# EasyEDA Pro project CAN Bus IO Module.epro, schematic Automotive Dashboard_1

## Sheets
1 Power and Connectors: Board Name: Automotive Dashboard; Create Date: 2026-03-18; Page Name: Power and Connectors; Project Name: PCB_PCB_Automotive-Dashboard_2025-10-05; Schematic Name: Automotive Dashboard; Update Date: 2026-04-06; Add into BOM: yes; Company: Indeterminate Design; Convert to PCB: yes; Date: 2024-12-05; Draw By: bselen; REV: 1.0; Sheet: 1/1; spicePre: .
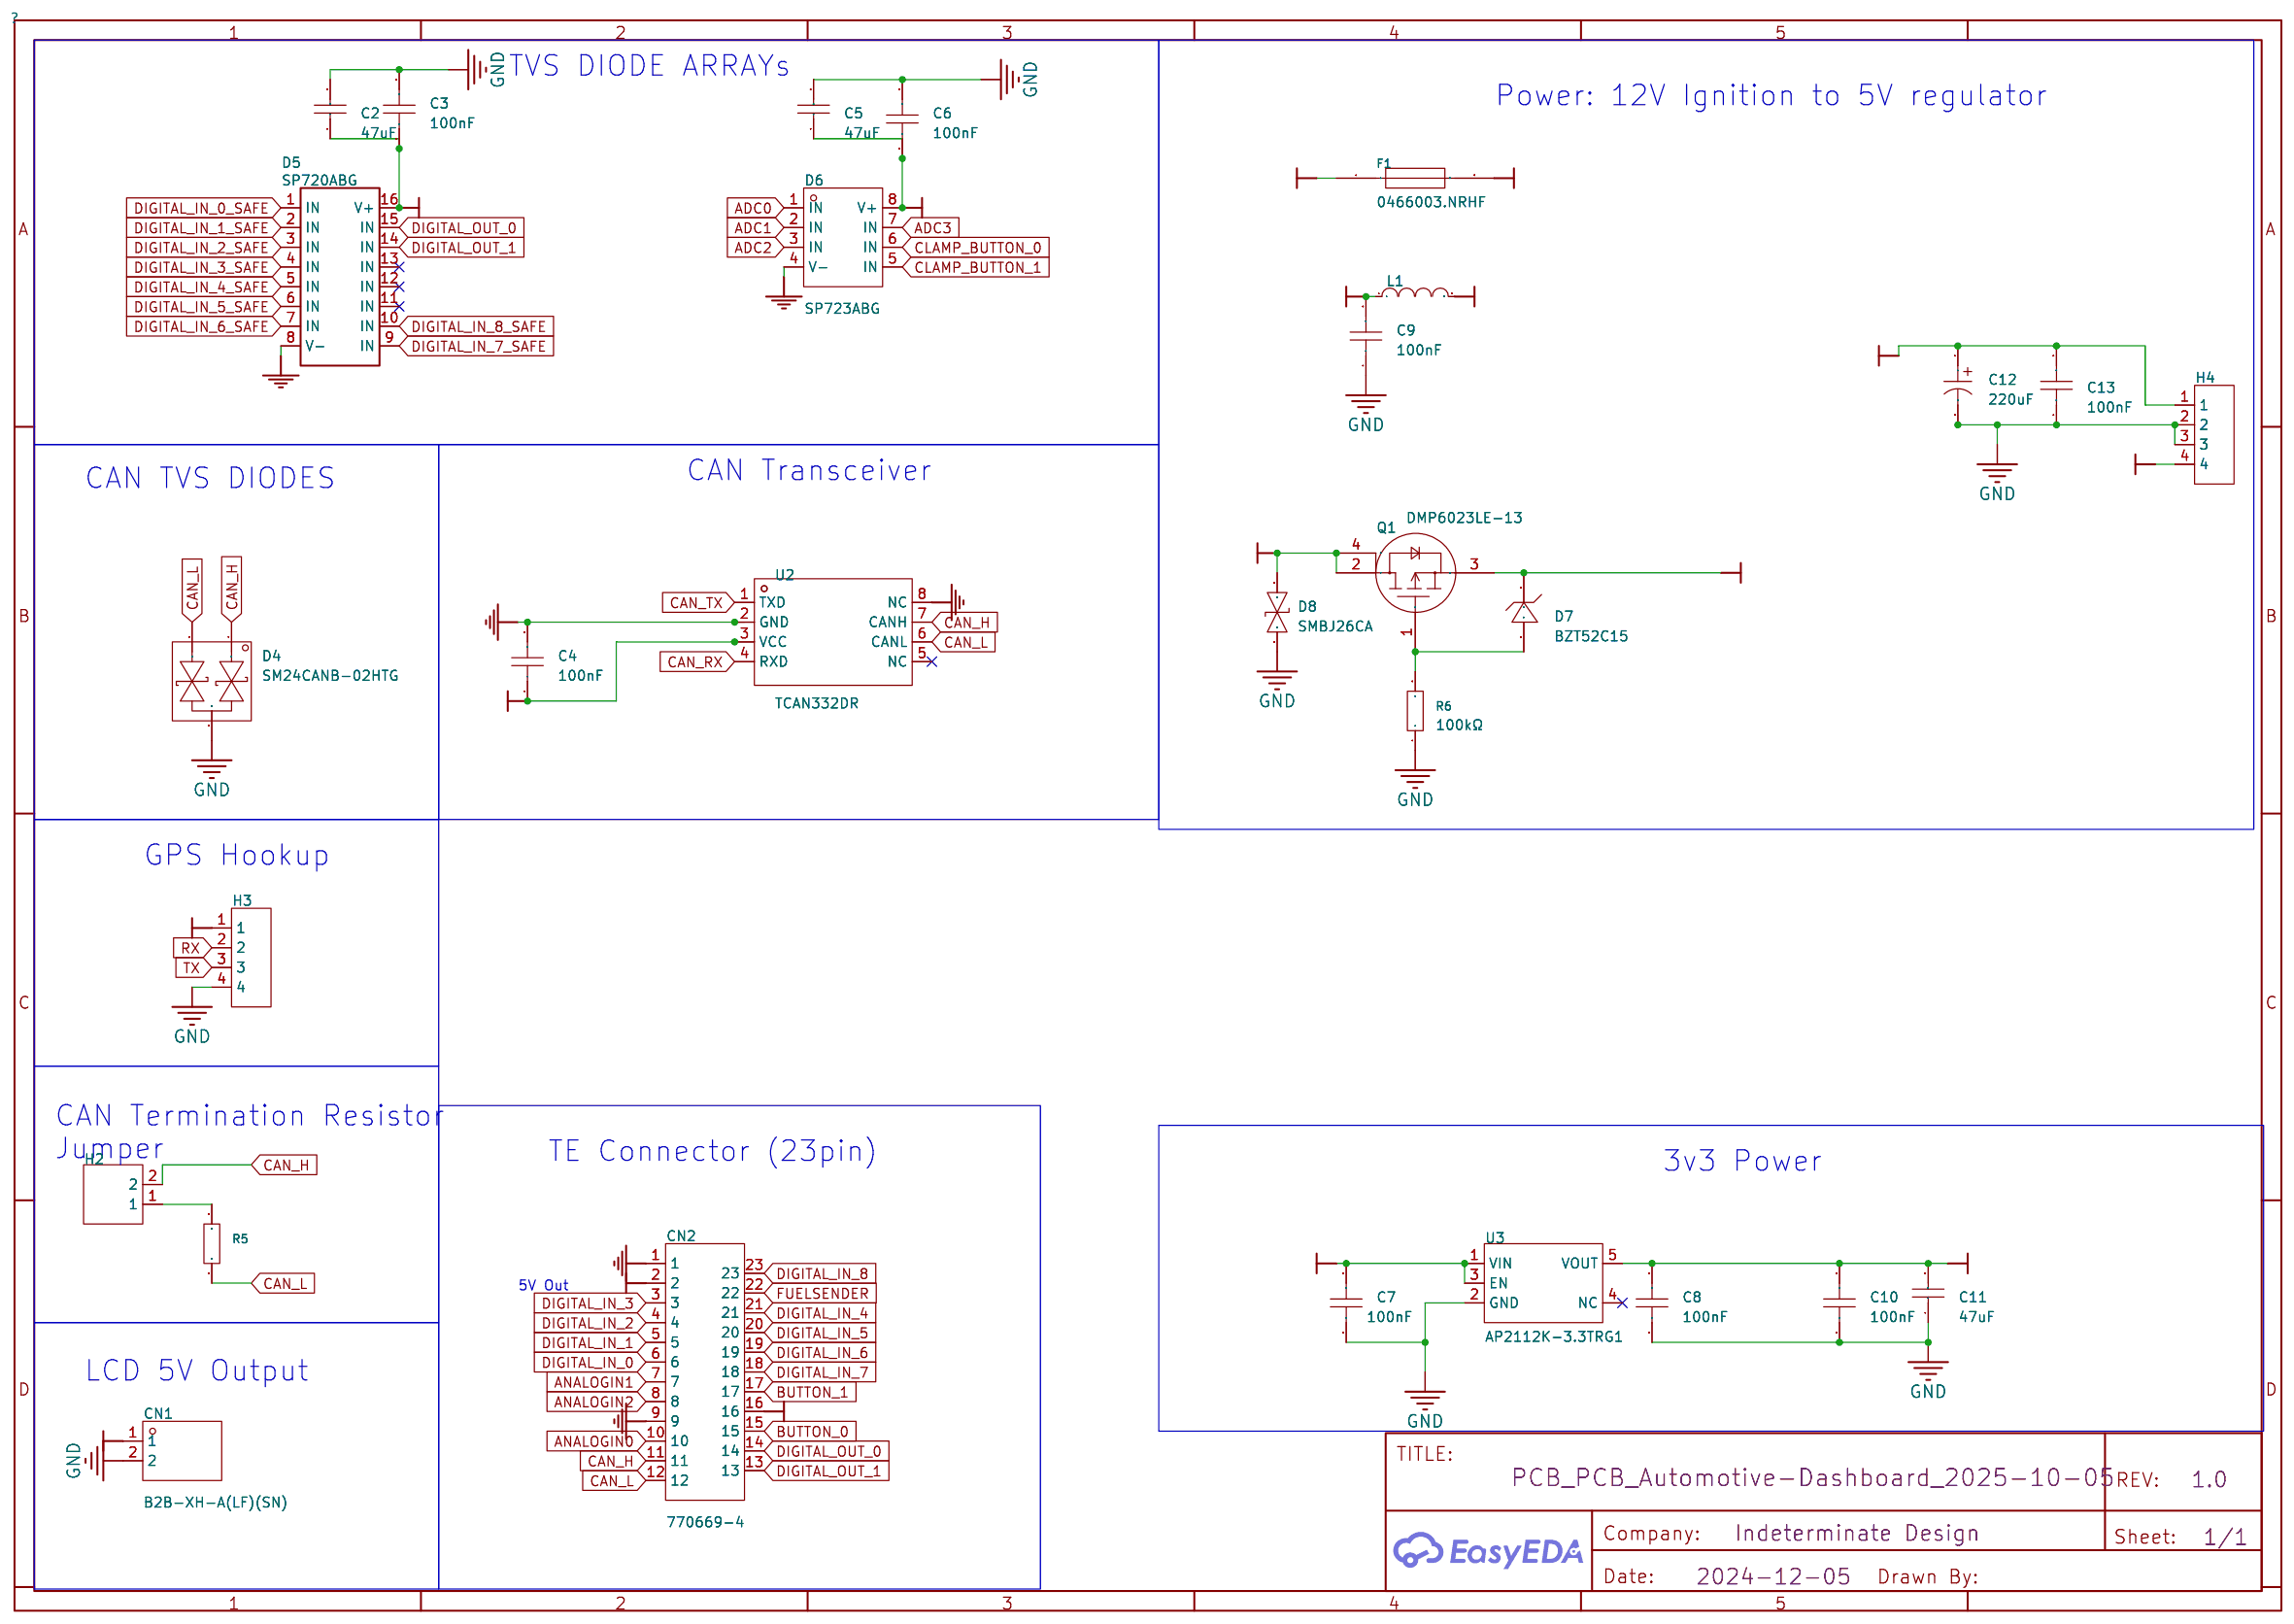
[diagram p0: Power and Connectors]
2 Digital Inputs: Page Name: Digital Inputs; Company: Your Company; Date: 2025-07-28
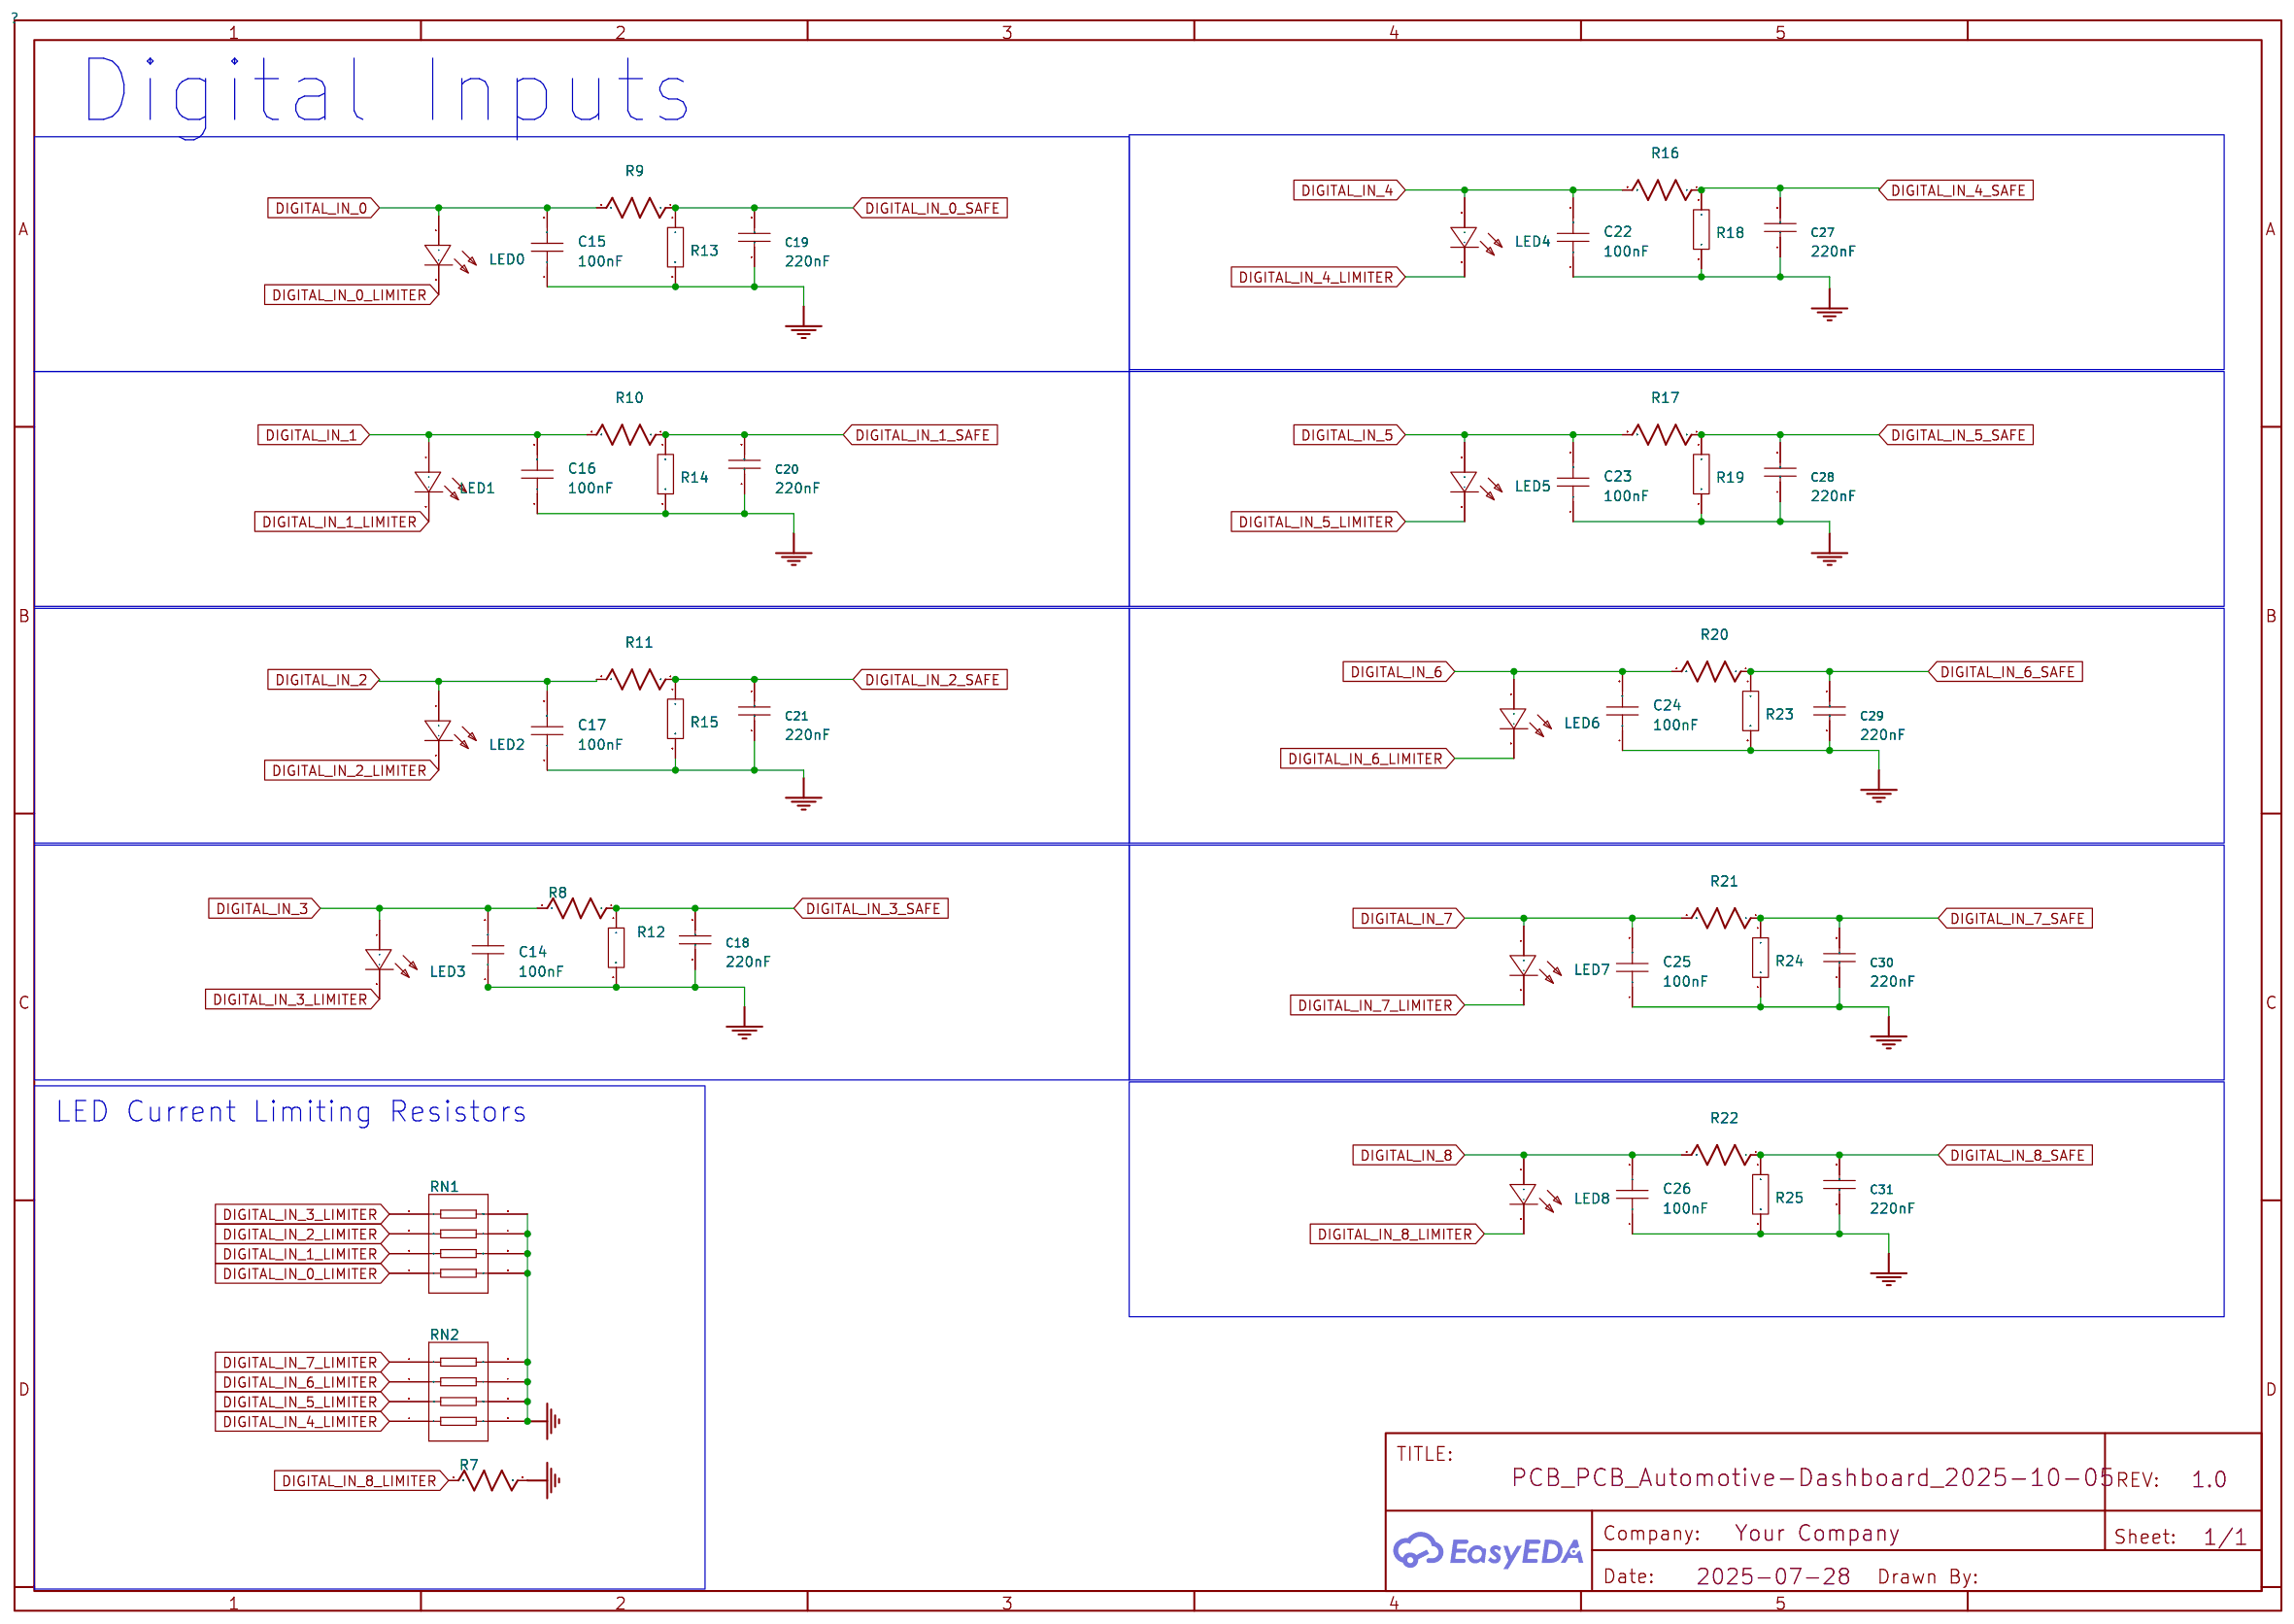
[diagram p1: Digital Inputs]
3 Analog Inputs: Page Name: Analog Inputs; Update Date: 2026-04-05; Company: Your Company; Date: 2025-07-28
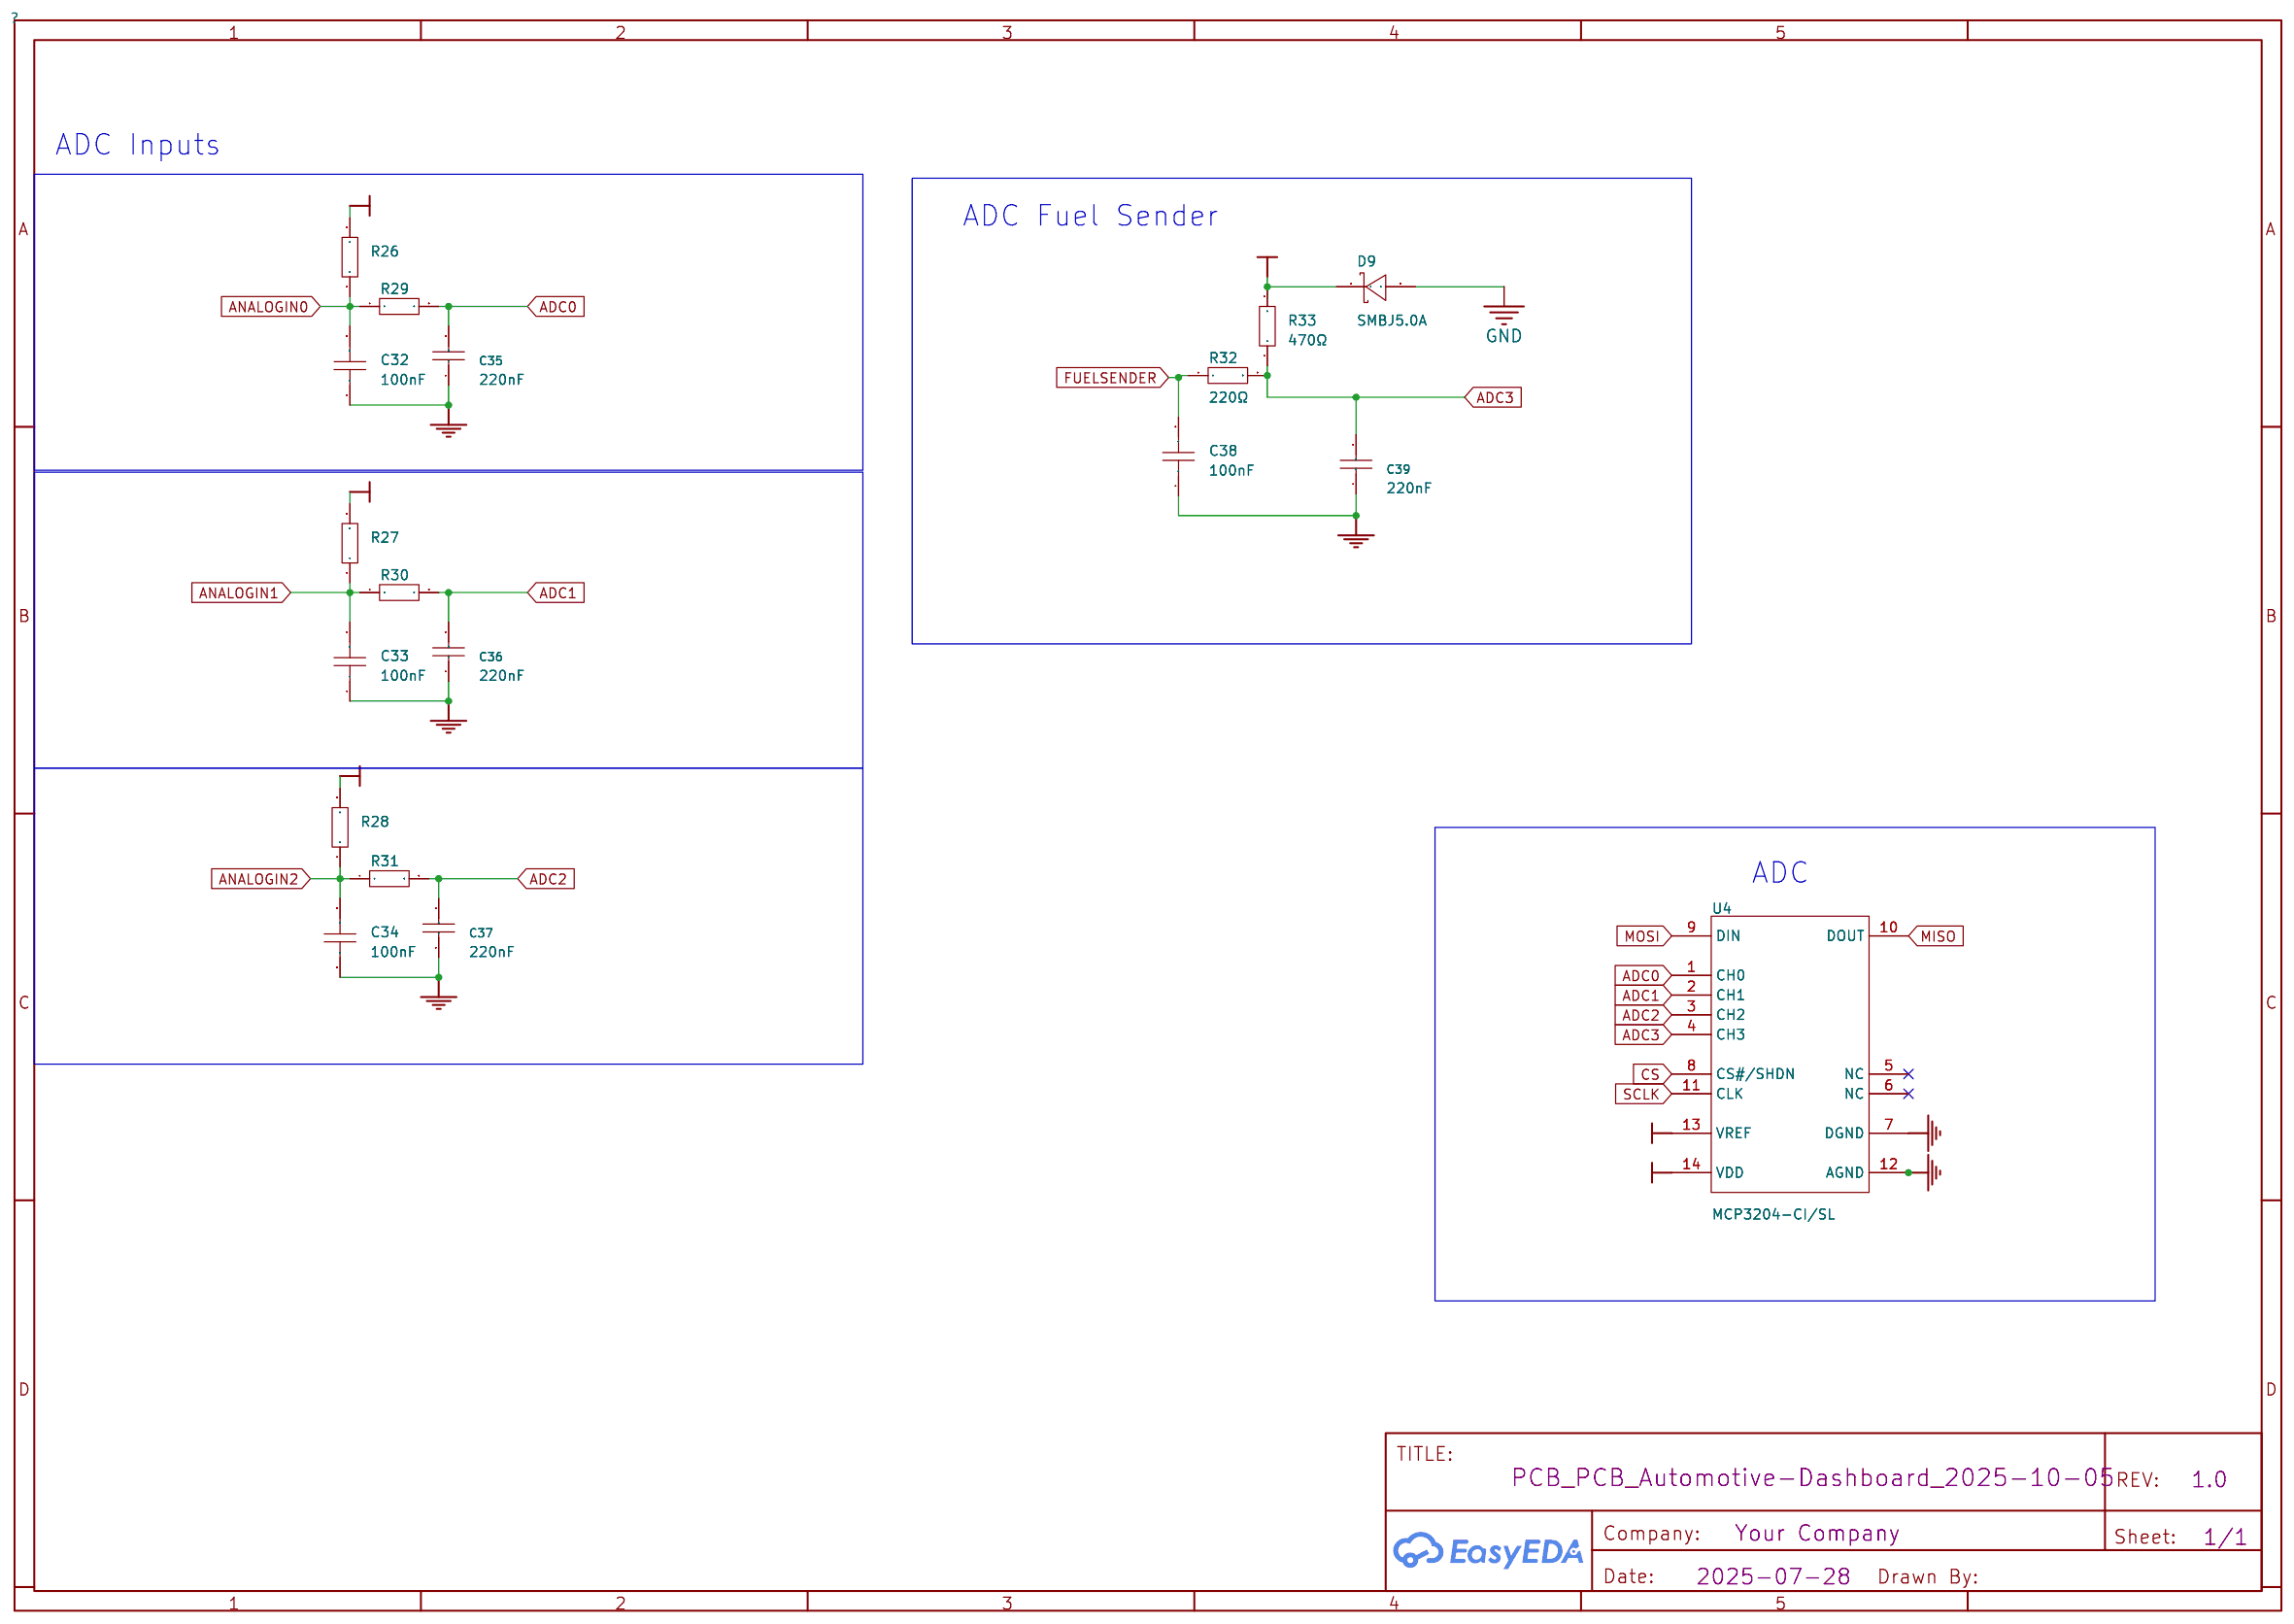
[diagram p2: Analog Inputs]
4 Buttons and Outputs: Page Name: Buttons and Outputs; Update Date: 2026-03-25; Company: EasyEDA.com; Page Size: A4; Version: V1.0
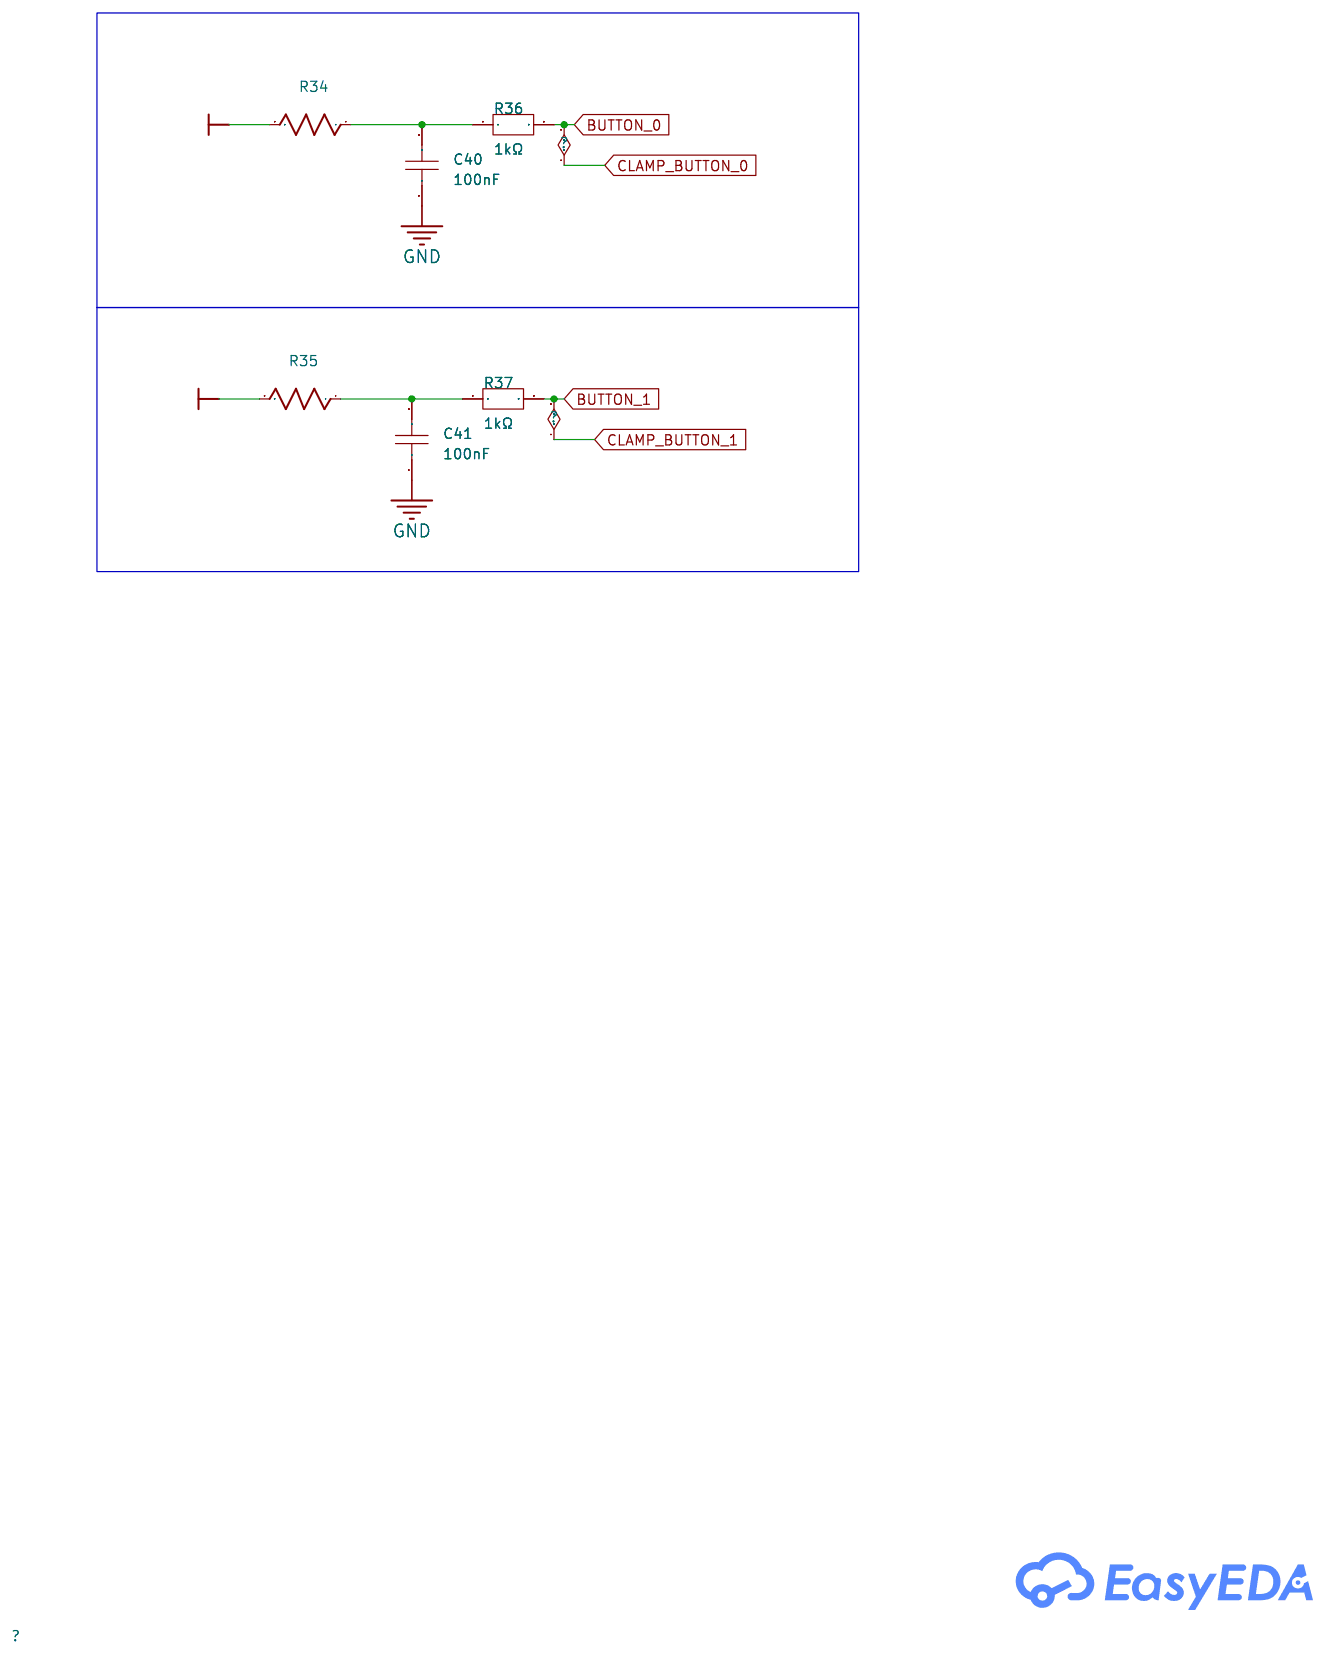
[diagram p3: Buttons and Outputs]
5 ESP32: Board Name: Automotive Dashboard_1; Create Date: 2026-05-01; Page Name: ESP32; Project Name: PCB_Automotive-Dashboard_V1.1_5_1; Schematic Name: Automotive Dashboard_1; Update Date: 2026-05-01; Company: EasyEDA.com; Page Size: A4; Version: V1.0
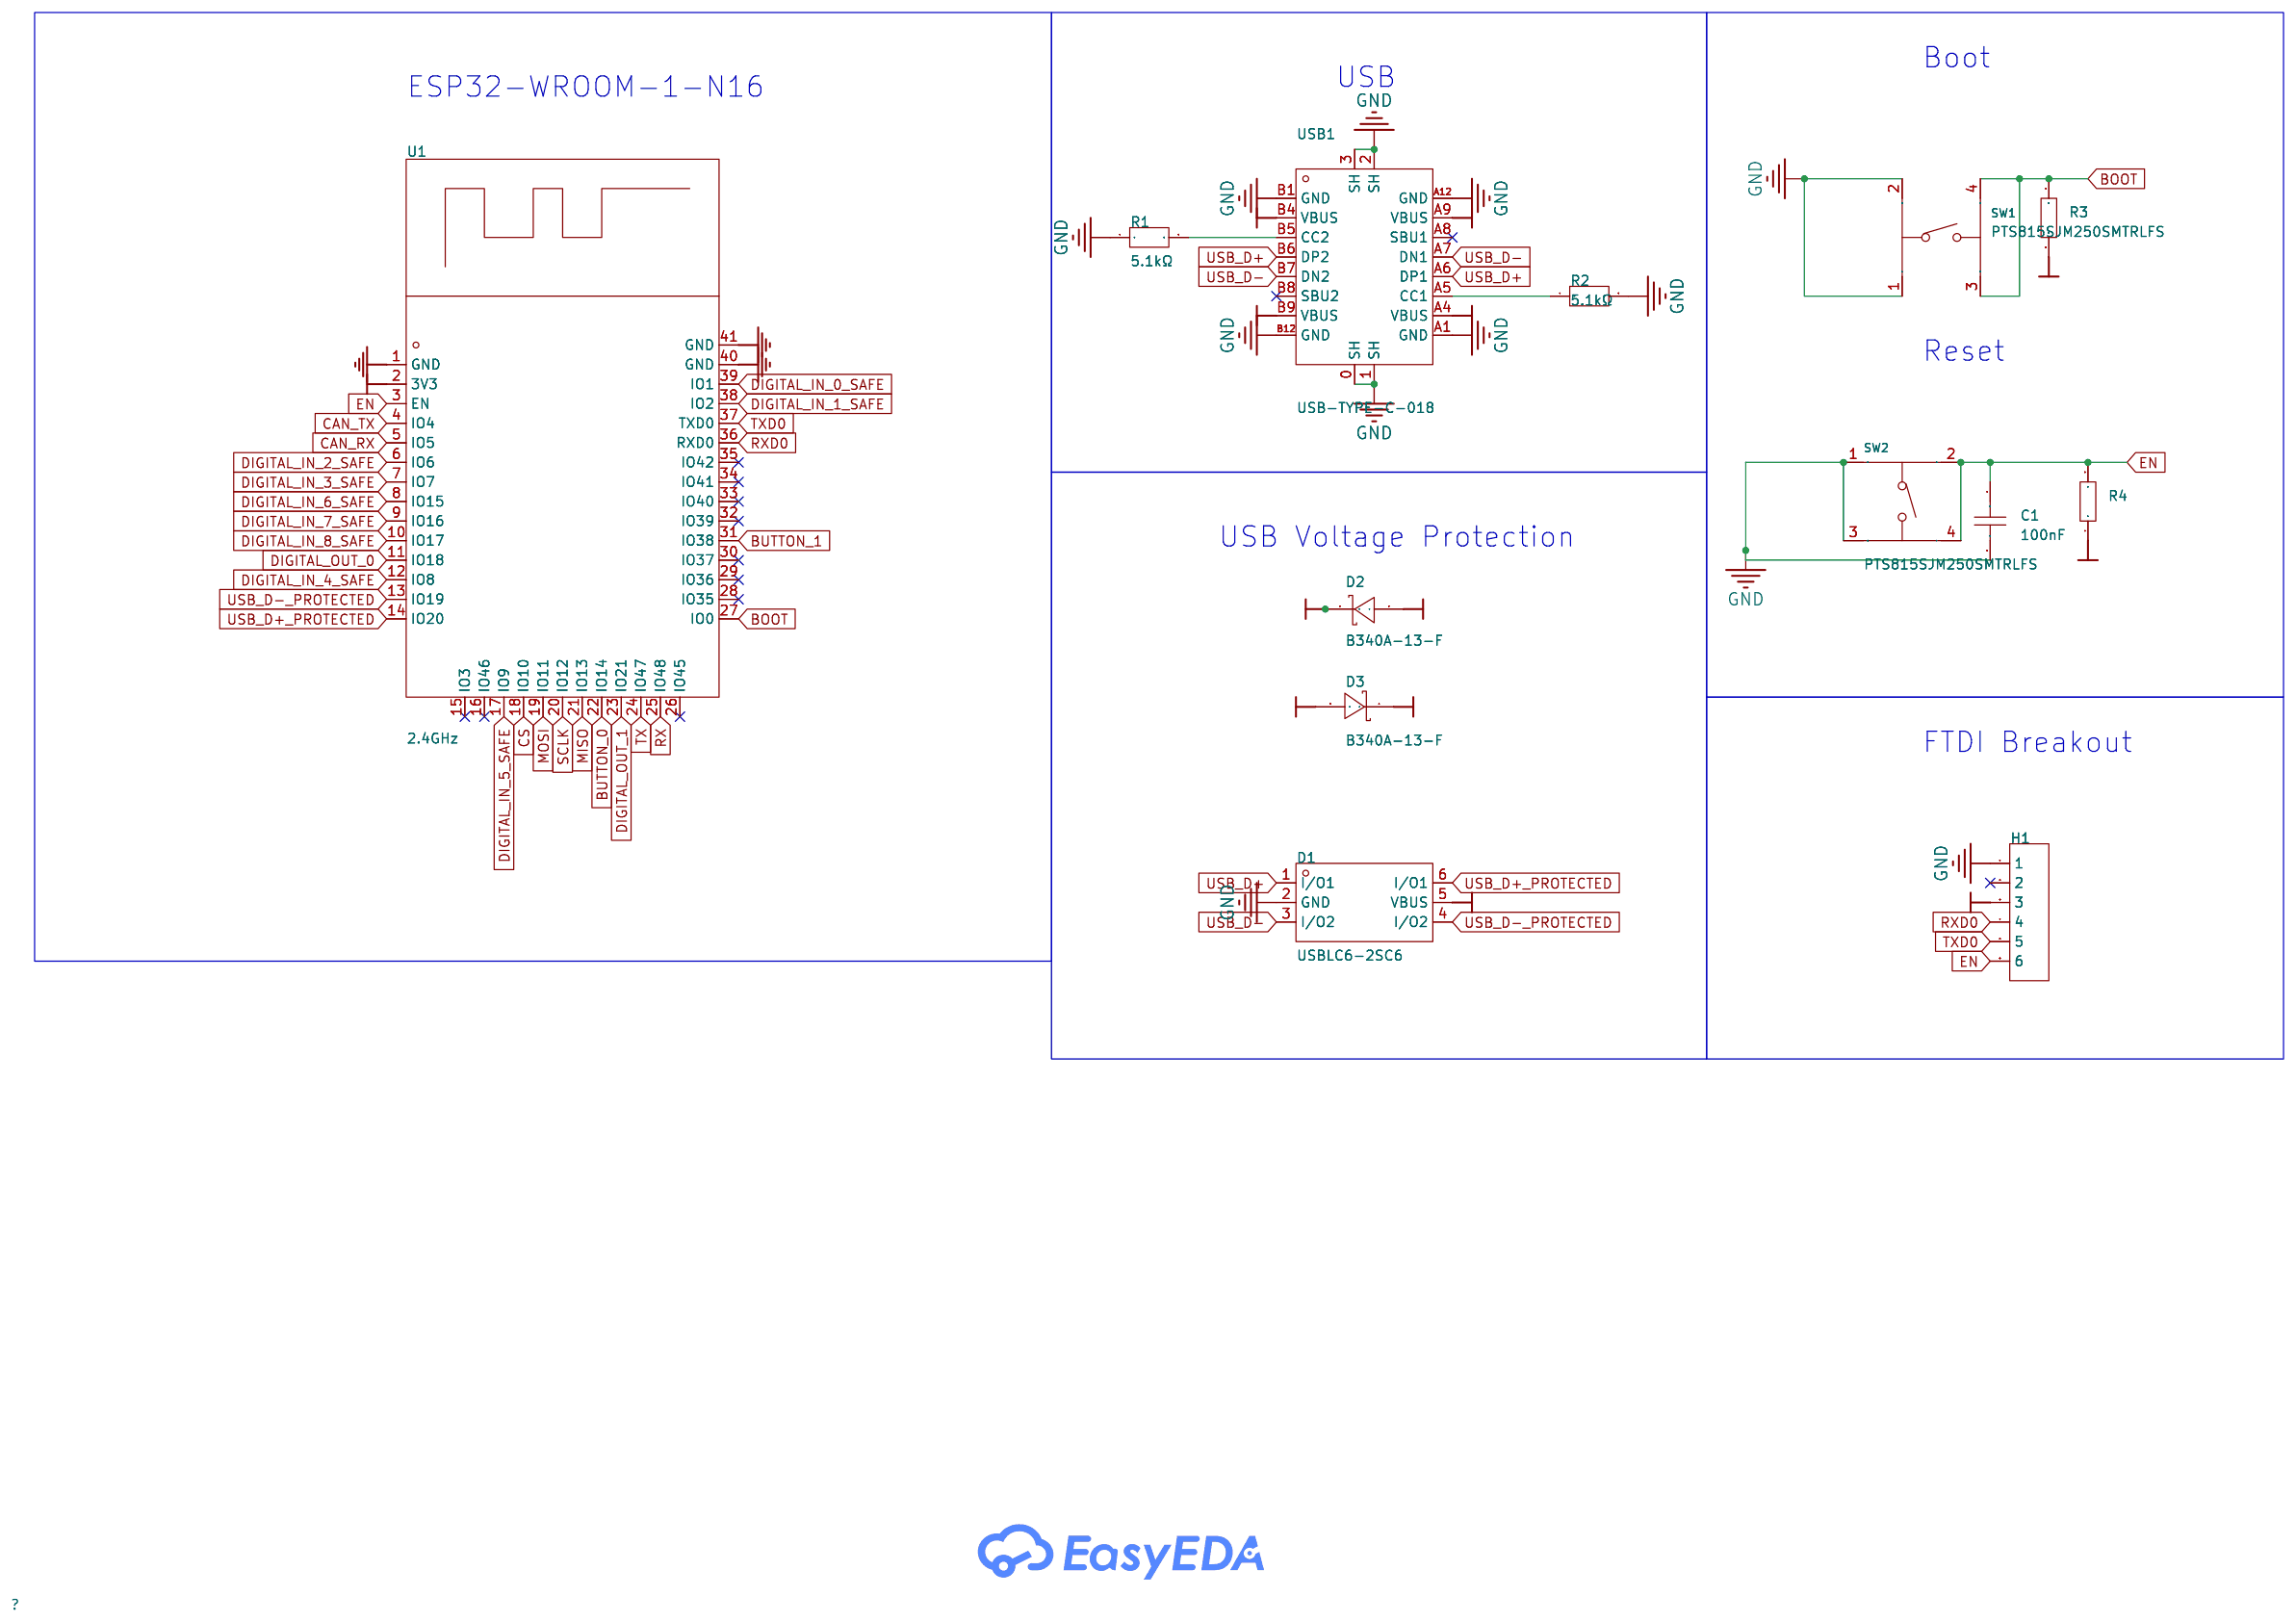
[diagram p4: ESP32]

## Parts
sheet Analog Inputs
C32  100nF  [C0805]
C33  100nF  [C0805]
C34  100nF  [C0805]
C35  220nF  [C0805]
C36  220nF  [C0805]
C37  220nF  [C0805]
C38  100nF  [C0805]
C39  220nF  [C0805]
D9  SMBJ5.0A  [SMB_L4.3-W3.6-LS5.4-RD]
R26  2.49kΩ  [R0805]
R27  2.49kΩ  [R0805]
R28  2.49kΩ  [R0805]
R29  470Ω  [R0805]
R30  470Ω  [R0805]
R31  470Ω  [R0805]
R32  220Ω  [RES-TH_BD1.8-L3.2-P7.20-D0.4]
R33  470Ω  [RES-TH_BD1.8-L3.2-P7.20-D0.4]
U4  MCP3204-CI/SL  [SOIC-14_L8.7-W3.9-P1.27-LS6.0-BL]
sheet Buttons and Outputs
C40  100nF  [C0805]
C41  100nF  [C0805]
R34  10kΩ  [R0805]
R35  10kΩ  [R0805]
R36  1kΩ  [R0805]
R37  1kΩ  [R0805]
sheet Digital Inputs
C14  100nF  [C0805]
C15  100nF  [C0805]
C16  100nF  [C0805]
C17  100nF  [C0805]
C18  220nF  [C0805]
C19  220nF  [C0805]
C20  220nF  [C0805]
C21  220nF  [C0805]
C22  100nF  [C0805]
C23  100nF  [C0805]
C24  100nF  [C0805]
C25  100nF  [C0805]
C26  100nF  [C0805]
C27  220nF  [C0805]
C28  220nF  [C0805]
C29  220nF  [C0805]
C30  220nF  [C0805]
C31  220nF  [C0805]
LED0  -  [LED0805-RD]
LED1  -  [LED0805-RD]
LED2  -  [LED0805-RD]
LED3  -  [LED0805-RD]
LED4  -  [LED0805-RD]
LED5  -  [LED0805-RD]
LED6  -  [LED0805-RD]
LED7  -  [LED0805-RD]
LED8  -  [LED0805-RD]
R7  4.7kΩ  [R0805]
R8  10kΩ  [R0805]
R9  10kΩ  [R0805]
R10  10kΩ  [R0805]
R11  10kΩ  [R0805]
R12  3.3kΩ  [R0805]
R13  3.3kΩ  [R0805]
R14  3.3kΩ  [R0805]
R15  3.3kΩ  [R0805]
R16  10kΩ  [R0805]
R17  10kΩ  [R0805]
R18  3.3kΩ  [R0805]
R19  3.3kΩ  [R0805]
R20  10kΩ  [R0805]
R21  10kΩ  [R0805]
R22  10kΩ  [R0805]
R23  3.3kΩ  [R0805]
R24  3.3kΩ  [R0805]
R25  3.3kΩ  [R0805]
RN1  4.7kΩ  [RES-ARRAY-SMD_0603-8P-L3.2-W1.6-BL]
RN2  4.7kΩ  [RES-ARRAY-SMD_0603-8P-L3.2-W1.6-BL]
sheet ESP32
C1  100nF  [C0805]
D1  USBLC6-2SC6  [SOT-23-6_L2.9-W1.6-P0.95-LS2.8-BL]
D2  B340A-13-F  [SMA_L4.4-W2.6-LS5.0-RD]
D3  B340A-13-F  [SMA_L4.4-W2.6-LS5.0-RD]
H1  -  [HDR-TH_6P-P2.54-V-M-1]
R1  5.1kΩ  [R0805]
R2  5.1kΩ  [R0805]
R3  10kΩ  [R0805]
R4  10kΩ  [R0805]
SW1  PTS815SJM250SMTRLFS  [KEY-SMD_4P-L4.2-W3.25-P2.15-TL]
SW2  PTS815SJM250SMTRLFS  [KEY-SMD_4P-L4.2-W3.25-P2.15-TL]
U1  2.4GHz  [WIRELM-SMD_ESP32-S3-WROOM-1]
USB1  USB-TYPE-C-018  [USB-C_SMD-TYPE-C-31-M-12]
sheet Power and Connectors
C2  47uF  [C0805]
C3  100nF  [C0805]
C4  100nF  [C0805]
C5  47uF  [C0805]
C6  100nF  [C0805]
C7  100nF  [C0805]
C8  100nF  [C0805]
C9  100nF  [C0805]
C10  100nF  [C0805]
C11  47uF  [C0805]
C12  220uF  [CAP-TH_BD10.0-P5.00-D0.6-FD_ERG50V220M10X13]
C13  100nF  [C0805]
CN1  B2B-XH-A(LF)(SN)  [CONN-TH_B2B-XH-A-LF-SN]
CN2  770669-4  [CONN-TH_23P-P4.00-S4.00_770669-4]
D4  SM24CANB-02HTG  [SOT-23-3_L2.9-W1.3-P1.90-LS2.4-BR]
D5  SP720ABG  [SOIC-16_L9.9-W3.9-P1.27-LS6.0-BL]
D6  SP723ABG  [SOIC-8_L4.9-W3.9-P1.27-LS6.0-BL]
D7  BZT52C15  [SOD-123_L2.8-W1.8-LS3.7-RD]
D8  SMBJ26CA  [SMB_L4.3-W3.6-LS5.4-BI]
F1  0466003.NRHF  [F1206]
H2  -  [HDR-TH_2P-P2.54-V-M-1]
H3  -  [HDR-TH_4P-P2.54-V-M]
H4  -  [HDR-TH_4P-P2.54-V-M]
L1  10uH  [IND-SMD_L8.0-W8.0]
Q1  DMP6023LE-13  [SOT-223-4_L6.5-W3.5-P2.30-LS7.0-BR]
R5  120Ω  [R0805]
R6  100kΩ  [R0805]
U2  TCAN332DR  [SOIC-8_L4.9-W3.9-P1.27-LS6.0-BL]
U3  AP2112K-3.3TRG1  [SOT-23-5_L2.9-W1.6-P0.95-LS2.8-BR]

## Library data of the parts
C1 C3 C4 C6-C10 C13-C17 C22-C26 C32-C34 C38 C40 C41 = CC0805KRX7R9BB104: Capacitance:100nF Tolerance:±10% Tolerance:±10% Voltage Rating:50V Temperature Coefficient:X7R; LCSC Part Name: 100nF ±10% 50V; Supplier Part: C49678; Manufacturer: YAGEO(国巨); Supplier Footprint: 0805; JLCPCB Part Class: Basic Part; Datasheet: https://item.szlcsc.com/datasheet/CC0805KRX7R9BB104/50686.html; Supplier: LCSC; Tolerance: ±10%; Voltage Rating: 50V; Temperature Coefficient: X7R
C18-C21 C27-C31 C35-C37 C39 = CC0805KKX7R9BB224: Capacitance:220nF Tolerance:±10% Tolerance:±10% Voltage Rating:50V Temperature Coefficient:X7R; LCSC Part Name: 220nF ±10% 50V; Supplier Part: C107131; Manufacturer: YAGEO(国巨); Supplier Footprint: 0805; JLCPCB Part Class: Extended Part; Datasheet: https://item.szlcsc.com/datasheet/CC0805KKX7R9BB224/108347.html; Supplier: LCSC; Tolerance: ±10%; Voltage Rating: 50V; Temperature Coefficient: X7R
D9 = SMBJ5.0A_C2758500: Polarity:Unidirectional Reverse Stand-Off Voltage (Vrwm):5V Clamping Voltage:9.2V Peak Pulse Current (Ipp):65.2A Peak Pulse Power Dissipation (Ppp):600W@10/1000us Voltage - Breakdown:6.4V Reverse Leakage Current (Ir):800uA level of protection:IEC 61000-4-; LCSC Part Name: 单向TVS 5V截止 峰值浪涌电流：65.2A; Supplier Part: C2758500; Manufacturer: UMW(友台半导体); Supplier Footprint: SMB(DO-214AA); JLCPCB Part Class: Extended Part; Datasheet: https://item.szlcsc.com/datasheet/SMBJ5.0A/2877402.html; Supplier: LCSC; Polarity: Unidirectional; Reverse Stand-Off Voltage (Vrwm): 5V; Clamping Voltage: 9.2V; Peak Pulse Current (Ipp): 65.2A; Peak Pulse Power Dissipation (Ppp): 600W@10/1000us; Voltage - Breakdown: 6.4V; Reverse Leakage Current (Ir): 800uA; level of protection: IEC 61000-4-4；IEC 61000-4-2; Type: TVS
R26-R28 = 0805W8F2491T5E: Type:Thick Film Resistors Resistance: Tolerance:±1% Tolerance:±1% Power(Watts): Temperature Coefficient:±100ppm/℃ Temperature Coefficient:±100ppm/℃ Overload Voltage (Max): Operating Temperature Range:-55℃~+155℃ Operating Temperature Range:-55℃~+155℃; LCSC Part Name: 2.49kΩ ±1% 125mW; Supplier Part: C21237; Manufacturer: UNI-ROYAL(厚声); Supplier Footprint: 0805; JLCPCB Part Class: Extended Part; Datasheet: https://atta.szlcsc.com/upload/public/pdf/source/20200306/C422600_1E6D84923E4A46A82E41ADD87F860B5C.pdf; Supplier: LCSC; Type: Thick Film Resistors; Tolerance: ±1%; Temperature Coefficient: ±100ppm/℃; Operating Temperature Range: -55℃~+155℃
R29-R31 = RC0805FR-07470RL: Type:Thick Film Resistors Resistance: Tolerance:±1% Tolerance:±1% Power(Watts): Temperature Coefficient:±100ppm/℃ Temperature Coefficient:±100ppm/℃ Overload Voltage (Max): Operating Temperature Range:-55℃~+155℃ Operating Temperature Range:-55℃~+155℃; LCSC Part Name: 470Ω ±1% 125mW; Supplier Part: C114564; Manufacturer: YAGEO(国巨); Supplier Footprint: 0805; JLCPCB Part Class: Extended Part; Datasheet: https://atta.szlcsc.com/upload/public/pdf/source/20170818/C114564_1503051144084895115.pdf; Supplier: LCSC; Type: Thick Film Resistors; Tolerance: ±1%; Temperature Coefficient: ±100ppm/℃; Operating Temperature Range: -55℃~+155℃
R32 R33 = Res_AXIAL-1/8W: Supplier Footprint: Through
U4 = MCP3204-CI/SL: Resolution(Bits):12 Sampling Rate:100kHz number of channels:4 Voltage - Supply:2.7V~5.5V Voltage - Supply:2.7V~5.5V Interface:SPI；Serial differential input:- Integral non - linearity:2LSB Integral non - linearity:2LSB Operating Temperature:-40℃~+85℃ Opera; Supplier Part: C32816; Manufacturer: MICROCHIP(美国微芯); Supplier Footprint: SOIC-14; Datasheet: https://item.szlcsc.com/datasheet/MCP3204-CI%252FSL/33781.html; Supplier: LCSC; Resolution(Bits): 12; Sampling Rate: 100kHz; number of channels: 4; Voltage - Supply: 2.7V~5.5V; Interface: SPI；Serial; Integral non - linearity: 2LSB; Operating Temperature: -40℃~+85℃
R3 R4 R8-R11 R16 R17 R20-R22 R34 R35 = AC0805FR-0710KL: Type:Thick Film Resistors Resistance: Tolerance: Power(Watts): Temperature Coefficient: Temperature Coefficient: Overload Voltage (Max): Operating Temperature Range: Operating Temperature Range:; LCSC Part Name: 10kΩ ±1%; Supplier Part: C140868; Manufacturer: YAGEO(国巨); Supplier Footprint: 0805; JLCPCB Part Class: Extended Part; Datasheet: https://atta.szlcsc.com/upload/public/pdf/source/20171113/C140868_15105613027091115785.pdf; Supplier: LCSC; Type: Thick Film Resistors
R36 R37 = RMC 0603 1K J N: Type:Thick Film Resistor Resistance:1kΩ Tolerance:±5% Tolerance:±5% Power(Watts):100mW Voltage-Supply(Max):50V Temperature Coefficient:±100ppm/℃ Temperature Coefficient:±100ppm/℃ Operating Temperature:-55℃~+155℃ Operating Temperature:-55℃~+155℃; Supplier Part: C5362357; Manufacturer: Tyohm(幸亚电阻); Supplier Footprint: 0603; JLCPCB Part Class: Extended Part; Datasheet: https://item.szlcsc.com/datasheet/RMC%25200603%25201K%2520J%2520N/6187171.html; Supplier: LCSC; Type: Thick Film Resistor; Tolerance: ±5%; Power(Watts): 100mW; Voltage-Supply(Max): 50V; Temperature Coefficient: ±100ppm/℃; Operating Temperature: -55℃~+155℃
LED0-LED8 = D-R080508L3-KS2: Emitted Color:红灯; LCSC Part Name: D-R080508L3-KS2  高亮红; Supplier Part: C130114; Manufacturer: 方舟 ARKLED; Supplier Footprint: 0805; JLCPCB Part Class: Extended Part; Datasheet: https://atta.szlcsc.com/upload/public/pdf/source/20170919/C130114_1505787182379976884.pdf; Supplier: LCSC; Emitted Color: 红灯
R7 = AC0805FR-074K7L: Type:Thick Film Resistors Resistance: Tolerance: Power(Watts): Temperature Coefficient: Temperature Coefficient: Overload Voltage (Max): Operating Temperature Range: Operating Temperature Range:; LCSC Part Name: 4.7kΩ ±1%; Supplier Part: C140869; Manufacturer: YAGEO(国巨); Supplier Footprint: 0805; JLCPCB Part Class: Extended Part; Datasheet: https://atta.szlcsc.com/upload/public/pdf/source/20171113/C140869_15105613035441115786.pdf; Supplier: LCSC; Type: Thick Film Resistors
R12-R15 R18 R19 R23-R25 = RMC08053.3K1%N: Type:Thick Film Resistor Resistance:3.3kΩ Tolerance:±1% Tolerance:±1% Power(Watts):125mW Voltage-Supply(Max):150V Temperature Coefficient:±100ppm/℃ Temperature Coefficient:±100ppm/℃ Operating Temperature:-55℃~+155℃ Operating Temperature:-55℃~+155℃; LCSC Part Name: 3.3kΩ ±1% 125mW; Supplier Part: C269541; Manufacturer: Tyohm(幸亚电阻); Supplier Footprint: 0805; JLCPCB Part Class: Extended Part; Datasheet: https://item.szlcsc.com/datasheet/RMC08053.3K1%2525N/258981.html; Supplier: LCSC; Type: Thick Film Resistor; Tolerance: ±1%; Power(Watts): 125mW; Voltage-Supply(Max): 150V; Temperature Coefficient: ±100ppm/℃; Operating Temperature: -55℃~+155℃
RN1 RN2 = 4D03WGJ0472T5E: Resistance: Tolerance:±5% Tolerance:±5% Power(Watts): Temperature Coefficient:±200ppm/℃ Temperature Coefficient:±200ppm/℃ Number of Resistors: Number of Pins:; LCSC Part Name: 4.7kΩ ±5%; Supplier Part: C1980; Manufacturer: UNI-ROYAL(厚声); Supplier Footprint: 0603x4; JLCPCB Part Class: Basic Part; Datasheet: https://atta.szlcsc.com/upload/public/pdf/source/20170615/1497510985624.pdf; Supplier: LCSC; Tolerance: ±5%; Temperature Coefficient: ±200ppm/℃
D1 = USBLC6-2SC6_C2687116: Maximum Clamping Voltage:15V Breakdown Voltage:6V Number of Lines:双路 Type:ESD; Supplier Part: C2687116; Manufacturer: UMW(友台半导体); Supplier Footprint: SOT-23-6; JLCPCB Part Class: Extended Part; Datasheet: https://atta.szlcsc.com/upload/public/pdf/source/20231109/512642D850D9873E7C519F71E85B9A10.pdf; Supplier: LCSC; Maximum Clamping Voltage: 15V; Breakdown Voltage: 6V; Number of Lines: 双路; Type: ESD
D2 D3 = B340A-13-F: Voltage - Forward(Vf@If):500mV@3A Voltage - DC Reverse(Vr):40V Current - Rectified:3A Reverse Leakage Current (Ir):500uA@40V Operating Junction Temperature Range:-55℃~+150℃ Operating Junction Temperature Range:-55℃~+150℃ Non-Repetitive Peak Forward Surge; LCSC Part Name: 电压:40V 电流:3A; Supplier Part: C85098; Manufacturer: DIODES(美台); Supplier Footprint: SMA(DO-214AC); JLCPCB Part Class: Extended Part; Datasheet: https://item.szlcsc.com/datasheet/B340A-13-F/86270.html; Supplier: LCSC; Voltage - Forward(Vf@If): 500mV@3A; Voltage - DC Reverse(Vr): 40V; Current - Rectified: 3A; Reverse Leakage Current (Ir): 500uA@40V; Operating Junction Temperature Range: -55℃~+150℃; Non-Repetitive Peak Forward Surge Current: 80A
H1 = HDR-M_2.54_1x6P: Supplier Footprint: Through
R1 R2 = RMC08055.1K1%N: Type:Thick Film Resistor Resistance:5.1kΩ Tolerance:±1% Tolerance:±1% Power(Watts):125mW Voltage-Supply(Max):150V Temperature Coefficient:±100ppm/℃ Temperature Coefficient:±100ppm/℃ Operating Temperature:-55℃~+155℃ Operating Temperature:-55℃~+155℃; LCSC Part Name: 5.1kΩ ±1% 125mW; Supplier Part: C269748; Manufacturer: Tyohm(幸亚电阻); Supplier Footprint: 0805; JLCPCB Part Class: Extended Part; Datasheet: https://item.szlcsc.com/datasheet/RMC08055.1K1%2525N/259188.html; Supplier: LCSC; Type: Thick Film Resistor; Tolerance: ±1%; Power(Watts): 125mW; Voltage-Supply(Max): 150V; Temperature Coefficient: ±100ppm/℃; Operating Temperature: -55℃~+155℃
SW1 SW2 = PTS815SJM250SMTRLFS: Circuit:SPST-常开 Actuator Style:Oval button Operating Force:180gf Mounting Style:Brick nogging Contact Current:50mA Voltage Rating (DC):12V IP Rating:IP40 Pin Style:J pin Operating Temperature:-20℃~+70℃ Operating Temperature:-20℃~+70℃; LCSC Part Name: 4.20*3.20用于SMT的轻触开关; Supplier Part: C2689510; Manufacturer: C&K; Supplier Footprint: SMD,3.2x4.2mm; JLCPCB Part Class: Extended Part; Datasheet: https://atta.szlcsc.com/upload/public/pdf/source/20210426/C2689510_3E3D7BFCEB769A9F83FFBA6DE03AECAC.pdf; Supplier: LCSC; Circuit: SPST-常开; Actuator Style: Oval button; Operating Force: 180gf; Mounting Style: Brick nogging; Contact Current: 50mA; Voltage Rating (DC): 12V; IP Rating: IP40; Pin Style: J pin; Operating Temperature: -20℃~+70℃
U1 = ESP32-S3-WROOM-1-N16: Utilized IC / Part:ESP32-S3 Wireless Standard:Bluetooth5.0 Interface Type:I2C；GPIO；UART；SPI；USB；I2S Frequency:2.4GHz Antenna Type:On-board PCB Antenna Output Power:20.5dBm Output Power:20.5dBm Voltage - Supply:3V~3.6V Voltage - Supply:3V~3.6V Receive  Cur; LCSC Part Name: 不带固件 通用型Wi-Fi+低功耗蓝牙MCU模组; Supplier Part: C2913199; Manufacturer: ESPRESSIF(乐鑫); Supplier Footprint: SMD,25.5x18mm; Datasheet: https://item.szlcsc.com/datasheet/ESP32-S3-WROOM-1-N16/3198297.html; Supplier: LCSC; Utilized IC / Part: ESP32-S3; Wireless Standard: Bluetooth5.0; Interface Type: I2C；GPIO；UART；SPI；USB；I2S; Antenna Type: On-board PCB Antenna; Output Power: 20.5dBm; Voltage - Supply: 3V~3.6V; Receive  Current: 95mA; Send  Current: 355mA; Sensitivity: -103.5dBm; Operating Temperature: -40℃~+85℃
USB1 = USB-TYPE-C-018: Connector Type:Type-C Protocol Standard:- Gender:Female Mounting Type:Surface Mount, Right Angle Number of Contacts:16P Number of Ports:1 Current Rating-Power:3A Voltage Rating:5V Connect-Disconnect Life:10,000 cycles Length:7.35mm Operating Temperature:-; LCSC Part Name: Type-C 母 卧贴; Supplier Part: C2927038; Manufacturer: DEALON(德艺隆); Supplier Footprint: SMD; Datasheet: https://item.szlcsc.com/datasheet/USB-TYPE-C-018/3252507.html; Supplier: LCSC; Connector Type: Type-C; Gender: Female; Mounting Type: Surface Mount, Right Angle; Number of Contacts: 16P; Number of Ports: 1; Current Rating-Power: 3A; Voltage Rating: 5V; Connect-Disconnect Life: 10,000 cycles; Length: 7.35mm; Operating Temperature: -25℃~+85℃
C2 C5 C11 = CL21A476MQYNNNE: Capacitance:47uF Tolerance:±20% Tolerance:±20% Voltage Rating:6.3V Temperature Coefficient:X5R; LCSC Part Name: 47uF ±20% 6.3V; Supplier Part: C16780; Manufacturer: SAMSUNG(三星); Supplier Footprint: 0805; Datasheet: https://item.szlcsc.com/datasheet/CL21A476MQYNNNE/17464.html; Supplier: LCSC; Tolerance: ±20%; Voltage Rating: 6.3V; Temperature Coefficient: X5R
C12 = ERG50V220M10X13: Capacitance:220uF Tolerance:±20% Tolerance:±20% Voltage Rating:50V Equivalent Series Resistance(ESR):120mΩ@100KHz Diameter:10mm Height - Seated (Max):13mm Operating Temperature:-40℃~+105℃ Operating Temperature:-40℃~+105℃; LCSC Part Name: 220uF ±20% 50V; Supplier Part: C51904472; Manufacturer: JIERR(捷而瑞); Supplier Footprint: 插件,D10xL13mm; JLCPCB Part Class: Extended Part; Datasheet: https://item.szlcsc.com/datasheet/ERG50V220M10X13/54596841.html; Supplier: LCSC; Tolerance: ±20%; Voltage Rating: 50V; Equivalent Series Resistance(ESR): 120mΩ@100KHz; Diameter: 10mm; Height - Seated (Max): 13mm; Operating Temperature: -40℃~+105℃
CN1 = B2B-XH-A(LF)(SN): Pins Structure:1x2P Pitch:2.5mm Mounting Type:Through Hole Reference Series:XH Number of Pins:2P Number of Rows:1 Number of PINs Per Row:2 Row Spacing:- Current Rating:3A Contact Material:Brass Contact Plating:Tin Operating Temperature:-25℃~+85℃ Operating; LCSC Part Name: 1x2P 间距:2.5mm 直插 系列:XH; Supplier Part: C158012; Manufacturer: JST; Supplier Footprint: 插件,P=2.5mm; Datasheet: https://item.szlcsc.com/datasheet/B2B-XH-A(LF)(SN)/169360.html; Supplier: LCSC; Pins Structure: 1x2P; Pitch: 2.5mm; Mounting Type: Through Hole; Reference Series: XH; Number of Pins: 2P; Number of Rows: 1; Number of PINs Per Row: 2; Current Rating: 3A; Contact Material: Brass; Contact Plating: Tin; Operating Temperature: -25℃~+85℃; Voltage Rating: 250V; Plastic Material: PA66; Flame Retardant Rating: UL94V-0; Supplementary Features: K Pin; Color: White; Z-Height of the Board: 7mm; X-Length of Bottom Edge on Board (Spacing Line): 7.4mm; Y-Width of Bottom Edge on Board: 5.75mm
CN2 = 770669-4: Supplier Part: C5166885; Manufacturer: TE Connectivity(泰科电子); Supplier Footprint: P=4mm; JLCPCB Part Class: Extended Part; Datasheet: https://item.szlcsc.com/datasheet/770669-4/5815861.html; Supplier: LCSC
D4 = SM24CANB-02HTG: Reverse Stand-Off Voltage (Vrwm):24V Clamping Voltage:50V Peak Pulse Current (Ipp):10A@8/20us Peak Pulse Power Dissipation (Ppp):500W@8/20us Voltage - Breakdown:26.7V Reverse Leakage Current (Ir):100nA level of protection:IEC 61000-4-5；IEC 61000-4-2 Type:; LCSC Part Name: TVS 24V截止 峰值浪涌电流：10A@8/20us; Supplier Part: C151237; Manufacturer: Littelfuse(美国力特); Supplier Footprint: SOT-23; JLCPCB Part Class: Extended Part; Datasheet: https://item.szlcsc.com/datasheet/SM24CANB-02HTG/162577.html; Supplier: LCSC; Reverse Stand-Off Voltage (Vrwm): 24V; Clamping Voltage: 50V; Peak Pulse Current (Ipp): 10A@8/20us; Peak Pulse Power Dissipation (Ppp): 500W@8/20us; Voltage - Breakdown: 26.7V; Reverse Leakage Current (Ir): 100nA; level of protection: IEC 61000-4-5；IEC 61000-4-2; Type: TVS; Junction Capacitance: 30pF
D5 = SP720ABG: Supplier: LCSC; Supplier Part: C5299847; Manufacturer: Littelfuse(美国力特); JLCPCB Part Class: Extended Part; Contributor: lcsc; spicePre: D
D6 = SP723ABG: Supplier Part: C2760754; Manufacturer: Littelfuse(美国力特); Supplier Footprint: SOIC-8; JLCPCB Part Class: Extended Part; Datasheet: https://atta.szlcsc.com/upload/public/pdf/source/20210322/C2760754_8631733CEE80A58BDFFAA1C34EF2AAA9.pdf; Supplier: LCSC
D7 = BZT52C15: Zener Voltage (Nom):15V Reverse Leakage Current (Ir):100nA@10.5V Power Dissipation:350mW; Supplier Part: C213127; Manufacturer: FMS(美丽微); Supplier Footprint: SOD-123; JLCPCB Part Class: Extended Part; Datasheet: https://atta.szlcsc.com/upload/public/pdf/source/20180504/C213135_4EC2B23C094A9BD9702BD830600A4A92.pdf; Supplier: LCSC; Zener Voltage (Nom): 15V; Reverse Leakage Current (Ir): 100nA@10.5V; Power Dissipation: 350mW
D8 = SMBJ26CA: Reverse Stand-Off Voltage (Vrwm):26V Maximum Clamping Voltage:42.1V Peak Pulse Current (Ipp)@10/1000us:14.3A Breakdown Voltage:28.9V Type:TVS; Supplier Part: C127563; Supplier Footprint: SMB(DO-214AA); JLCPCB Part Class: Extended Part; Datasheet: https://atta.szlcsc.com/upload/public/pdf/source/20190828/C415856_91585ADD1001807004044059320FFAFB.pdf; Supplier: LCSC; Reverse Stand-Off Voltage (Vrwm): 26V; Maximum Clamping Voltage: 42.1V; Peak Pulse Current (Ipp)@10/1000us: 14.3A; Breakdown Voltage: 28.9V; Type: TVS
F1 = 0466003.NRHF: Type:Surface Mount Fuse Current Rating:3A Voltage Rating (AC):32V Voltage Rating (DC):32V Operating Temperature:-55℃~+90℃ Operating Temperature:-55℃~+90℃ Interrupt Rating:50A; LCSC Part Name: 32V贴片式保险丝; Supplier Part: C14165; Manufacturer: Littelfuse(美国力特); Supplier Footprint: 1206; JLCPCB Part Class: Extended Part; Datasheet: https://item.szlcsc.com/datasheet/0466003.NRHF/14822.html; Supplier: LCSC; Type: Surface Mount Fuse; Current Rating: 3A; Voltage Rating (AC): 32V; Voltage Rating (DC): 32V; Operating Temperature: -55℃~+90℃; Interrupt Rating: 50A
H2 = HDR-M_2.54_1x2P: Supplier Footprint: Through
H3 H4 = HDR-M_2.54_1x4P: Supplier Footprint: Through
L1 = YNR8040-100M: Inductance:10uH Tolerance:±20% Tolerance:±20% Current Rating:3.3A DC Resistance(DCR):29mΩ Type:Magnetic Shielded Inductor; LCSC Part Name: 10uH ±20%; Supplier Part: C341077; Manufacturer: YJYCOIN(益嘉源); Supplier Footprint: SMD,8x8mm; JLCPCB Part Class: Extended Part; Datasheet: https://item.szlcsc.com/datasheet/YNR8040-100M/318294.html; Supplier: LCSC; Tolerance: ±20%; Current Rating: 3.3A; DC Resistance(DCR): 29mΩ; Type: Magnetic Shielded Inductor
Q1 = DMP6023LE-13: Number:1 P-Channel Drain to Source Voltage:60V Current - Continuous Drain(Id):7A RDS(on):35mΩ@4.5V,4A Pd - Power Dissipation:2W Gate Threshold Voltage (Vgs(th)):3V@250uA Gate Charge(Qg):53.1nC@10V Input Capacitance(Ciss):2.569nF Reverse Transfer Capacitan; LCSC Part Name: 1个P沟道 耐压:60V 电流:7A; Supplier Part: C154901; Manufacturer: DIODES(美台); Supplier Footprint: SOT-223; JLCPCB Part Class: Extended Part; Datasheet: https://item.szlcsc.com/datasheet/DMP6023LE-13/166243.html; Supplier: LCSC; Number: 1 P-Channel; Drain to Source Voltage: 60V; Current - Continuous Drain(Id): 7A; RDS(on): 35mΩ@4.5V,4A; Pd - Power Dissipation: 2W; Gate Threshold Voltage (Vgs(th)): 3V@250uA; Gate Charge(Qg): 53.1nC@10V; Input Capacitance(Ciss): 2.569nF; Reverse Transfer Capacitance (Crss@Vds): 143pF; Operating Temperature: -55℃~+150℃; Type: P-Channel; Output Capacitance(Coss): 179pF
R5 = RMC 0805 120R J N: Type:Thick Film Resistor Resistance:120Ω Tolerance:±5% Tolerance:±5% Power(Watts):125mW Voltage-Supply(Max):150V Temperature Coefficient:±100ppm/℃ Temperature Coefficient:±100ppm/℃ Operating Temperature:-55℃~+155℃ Operating Temperature:-55℃~+155℃; LCSC Part Name: 120Ω ±5% 125mW; Supplier Part: C269726; Manufacturer: Tyohm(幸亚电阻); Supplier Footprint: 0805; JLCPCB Part Class: Extended Part; Datasheet: https://item.szlcsc.com/datasheet/RMC%25200805%2520120R%2520J%2520N/259166.html; Supplier: LCSC; Type: Thick Film Resistor; Tolerance: ±5%; Power(Watts): 125mW; Voltage-Supply(Max): 150V; Temperature Coefficient: ±100ppm/℃; Operating Temperature: -55℃~+155℃
R6 = 0805W8F1003T5E: Type:Thick Film Resistor Resistance:100kΩ Tolerance:±1% Tolerance:±1% Power(Watts):125mW Voltage-Supply(Max):150V Temperature Coefficient:±100ppm/℃ Temperature Coefficient:±100ppm/℃ Operating Temperature:-55℃~+155℃ Operating Temperature:-55℃~+155℃; LCSC Part Name: 100kΩ ±1% 125mW 厚膜电阻; Supplier Part: C149504; Manufacturer: UNI-ROYAL(厚声); Supplier Footprint: 0805; Datasheet: https://item.szlcsc.com/datasheet/0805W8F1003T5E/160838.html; Supplier: LCSC; Type: Thick Film Resistor; Tolerance: ±1%; Power(Watts): 125mW; Voltage-Supply(Max): 150V; Temperature Coefficient: ±100ppm/℃; Operating Temperature: -55℃~+155℃
U2 = TCAN332DR: Type:CAN Transceiver Data Rate:1Mbps Voltage - Supply:3V~3.6V Voltage - Supply:3V~3.6V Current - Supply:60mA Operating Temperature:-40℃~+125℃ Operating Temperature:-40℃~+125℃ Number of Channels:1 Quiescent Supply Current:3.5mA; LCSC Part Name: TCAN33X具备CANFD（灵活数据速率）的3.3VCAN收发器; Supplier Part: C73651; Manufacturer: TI(德州仪器); Supplier Footprint: SOIC-8; JLCPCB Part Class: Extended Part; Datasheet: https://www.ti.com/cn/lit/gpn/tcan337; Supplier: LCSC; Type: CAN Transceiver; Data Rate: 1Mbps; Voltage - Supply: 3V~3.6V; Current - Supply: 60mA; Operating Temperature: -40℃~+125℃; Number of Channels: 1; Quiescent Supply Current: 3.5mA
U3 = AP2112K-3.3TRG1_C23380830: Output Type:Fixed Voltage - Supply:5.5V Output Voltage:3.3V Output Voltage:3.3V Output Current:600mA Power Supply Rejection Ratio (PSRR):75dB@(1kHz) Voltage Dropout:320mV@(600mA) standby current:10uA Features:Over Temperature Protection Operating Temperat; LCSC Part Name: 3.3V 600mA 5.5V; Supplier Part: C23380830; Manufacturer: TECH PUBLIC(台舟); Supplier Footprint: SOT-23-5; Datasheet: https://item.szlcsc.com/datasheet/AP2112K-3.3TRG1/25111500.html; Supplier: LCSC; Output Type: Fixed; Voltage - Supply: 5.5V; Output Voltage: 3.3V; Output Current: 600mA; Power Supply Rejection Ratio (PSRR): 75dB@(1kHz); Voltage Dropout: 320mV@(600mA); standby current: 10uA; Features: Over Temperature Protection; Operating Temperature: -40℃~+85℃@(Ta); Output Configuration: Positive; Number of Outputs: 1

## Nets
+3V3: C2.1 C3.1 C4.1 C5.1 C6.1 C8.2 C10.2 C11.2 D5.16(V+) D6.8(V+) H1.3 H3.1 R3.2 R4.1 R26.2 R27.2 R28.2 R34.2 R35.2 U1.2(3V3) U2.3(VCC) U3.5(VOUT) U4.13(VREF) U4.14(VDD)
+5V: CN1.1 CN2.2 D2.2(A) D9.1(K) H4.4 R33.2
+12VFUSED: D8.1 F1.2 Q1.2(D) Q1.4(D)
+12VIGN: CN2.16 F1.1
+12VPROTECTED: C9.2 D7.1 L1.1 Q1.3(S)
+12VPROTECTED_L: C12.1 C13.2 H4.1 L1.2
GND: C1.2 C2.2 C3.2 C4.2 C5.2 C6.2 C7.1 C8.1 C9.1 C10.1 C11.1 C12.2 C13.1 C14.1 C15.1 C16.1 C17.1 C18.1 C19.1 C20.1 C21.1 C22.1 C23.1 C24.1 C25.1 C26.1 C27.1 C28.1 C29.1 C30.1 C31.1 C32.1 C33.1 C34.1 C35.1 C36.1 C37.1 C38.1 C39.1 C40.1 C41.1 CN1.2 CN2.1 CN2.9 D1.2(GND) D4.3 D5.8(V-) D6.4(V-) D8.2 D9.2(A) H1.1 H3.4 H4.2 H4.3 R1.1 R2.2 R6.1 R7.2 R12.2 R13.2 R14.2 R15.2 R18.2 R19.2 R23.2 R24.2 R25.2 RN1.5 RN1.6 RN1.7 RN1.8 RN2.5 RN2.6 RN2.7 RN2.8 SW1.1 SW1.2 SW2.1 SW2.3 U1.1(GND) U1.40(GND) U1.41(GND) U2.2(GND) U2.8(NC) U3.2(GND) U4.7(DGND) U4.12(AGND) USB1.0(SH) USB1.1(SH) USB1.2(SH) USB1.3(SH) USB1.A1(GND) USB1.A12(GND) USB1.B1(GND) USB1.B12(GND)
VBUS: D1.5(VBUS) D3.2(A) USB1.A4(VBUS) USB1.A9(VBUS) USB1.B4(VBUS) USB1.B9(VBUS)
+5LDO: C7.2 D2.1(K) D3.1(K) U3.1(VIN) U3.3(EN)
ADC0: C35.2 D6.1(IN) R29.2 U4.1(CH0)
ADC1: C36.2 D6.2(IN) R30.2 U4.2(CH1)
ADC2: C37.2 D6.3(IN) R31.2 U4.3(CH2)
ADC3: C39.2 D6.7(IN) R32.2 R33.1 U4.4(CH3)
ANALOGIN0: C32.2 CN2.10 R26.1 R29.1
ANALOGIN1: C33.2 CN2.7 R27.1 R30.1
ANALOGIN2: C34.2 CN2.8 R28.1 R31.1
BOOT: R3.1 SW1.3 SW1.4 U1.27(IO0)
BUTTON_0: CN2.15 D6.6(IN) R36.2 U1.22(IO14)
BUTTON_1: CN2.17 D6.5(IN) R37.2 U1.31(IO38)
CAN_H: CN2.11 D4.1 H2.2 U2.7(CANH)
CAN_L: CN2.12 D4.2 R5.1 U2.6(CANL)
CAN_RX: U1.5(IO5) U2.4(RXD)
CAN_TX: U1.4(IO4) U2.1(TXD)
CS: U1.18(IO10) U4.8(CS#/SHDN)
DIGITAL_IN_0: C15.2 CN2.6 LED0.1(+) R9.2
DIGITAL_IN_0_LIMITER: LED0.2(-) RN1.4
DIGITAL_IN_0_SAFE: C19.2 D5.1(IN) R9.1 R13.1 U1.39(IO1)
DIGITAL_IN_1: C16.2 CN2.5 LED1.1(+) R10.2
DIGITAL_IN_1_LIMITER: LED1.2(-) RN1.3
DIGITAL_IN_1_SAFE: C20.2 D5.2(IN) R10.1 R14.1 U1.38(IO2)
DIGITAL_IN_2: C17.2 CN2.4 LED2.1(+) R11.2
DIGITAL_IN_2_LIMITER: LED2.2(-) RN1.2
DIGITAL_IN_2_SAFE: C21.2 D5.3(IN) R11.1 R15.1 U1.6(IO6)
DIGITAL_IN_3: C14.2 CN2.3 LED3.1(+) R8.2
DIGITAL_IN_3_LIMITER: LED3.2(-) RN1.1
DIGITAL_IN_3_SAFE: C18.2 D5.4(IN) R8.1 R12.1 U1.7(IO7)
DIGITAL_IN_4: C22.2 CN2.21 LED4.1(+) R16.2
DIGITAL_IN_4_LIMITER: LED4.2(-) RN2.4
DIGITAL_IN_4_SAFE: C27.2 D5.5(IN) R16.1 R18.1 U1.12(IO8)
DIGITAL_IN_5: C23.2 CN2.20 LED5.1(+) R17.2
DIGITAL_IN_5_LIMITER: LED5.2(-) RN2.3
DIGITAL_IN_5_SAFE: C28.2 D5.6(IN) R17.1 R19.1 U1.17(IO9)
DIGITAL_IN_6: C24.2 CN2.19 LED6.1(+) R20.2
DIGITAL_IN_6_LIMITER: LED6.2(-) RN2.2
DIGITAL_IN_6_SAFE: C29.2 D5.7(IN) R20.1 R23.1 U1.8(IO15)
DIGITAL_IN_7: C25.2 CN2.18 LED7.1(+) R21.2
DIGITAL_IN_7_LIMITER: LED7.2(-) RN2.1
DIGITAL_IN_7_SAFE: C30.2 D5.9(IN) R21.1 R24.1 U1.9(IO16)
DIGITAL_IN_8: C26.2 CN2.23 LED8.1(+) R22.2
DIGITAL_IN_8_LIMITER: LED8.2(-) R7.1
DIGITAL_IN_8_SAFE: C31.2 D5.10(IN) R22.1 R25.1 U1.10(IO17)
DIGITAL_OUT_0: CN2.14 D5.15(IN) U1.11(IO18)
DIGITAL_OUT_1: CN2.13 D5.14(IN) U1.23(IO21)
EN: C1.1 H1.6 R4.2 SW2.2 SW2.4 U1.3(EN)
FUELSENDER: C38.2 CN2.22 R32.1
MISO: U1.21(IO13) U4.10(DOUT)
MOSI: U1.19(IO11) U4.9(DIN)
RX: H3.2 U1.25(IO48)
RXD0: H1.4 U1.36(RXD0)
SCLK: U1.20(IO12) U4.11(CLK)
TX: H3.3 U1.24(IO47)
TXD0: H1.5 U1.37(TXD0)
USB_D+: D1.1(I/O1) USB1.A6(DP1) USB1.B6(DP2)
USB_D+_PROTECTED: D1.6(I/O1) U1.14(IO20)
USB_D-: D1.3(I/O2) USB1.A7(DN1) USB1.B7(DN2)
USB_D-_PROTECTED: D1.4(I/O2) U1.13(IO19)
$1N19184: H2.1 R5.2
$1N26408: D7.2 Q1.1(G) R6.2
$4N352: C40.2 R34.1 R36.1
$4N509: C41.2 R35.1 R37.1
$5N952: R2.1 USB1.A5(CC1)
$5N991: R1.2 USB1.B5(CC2)

Not connected (* = marked no-connect by the designer): D5 11(IN)* 12(IN)* 13(IN)*; H1 2*; U1 15(IO3)* 16(IO46)* 26(IO45)* 28(IO35)* 29(IO36)* 30(IO37)* 32(IO39)* 33(IO40)* 34(IO41)* 35(IO42)*; U2 5(NC)*; U3 4(NC)*; U4 5(NC)* 6(NC)*; USB1 A8(SBU1)* B8(SBU2)*

## Notes on the sheets
sheet 1
- TVS DIODE ARRAYs
- Power: 12V Ignition to 5V regulator
- CAN TVS DIODES
- CAN Transceiver
- GPS Hookup
- CAN Termination Resistor
  Jumper
- TE Connector (23pin)
- 3v3 Power
- 5V Out
- LCD 5V Output
sheet 2
- Digital Inputs
- LED Current Limiting Resistors
sheet 3
- ADC Inputs
- ADC Fuel Sender
- ADC
sheet 5
- USB
- Boot
- ESP32-WROOM-1-N16
- Reset
- USB Voltage Protection
- FTDI Breakout
